# Altium project QiRec-5-T.PrjPcb
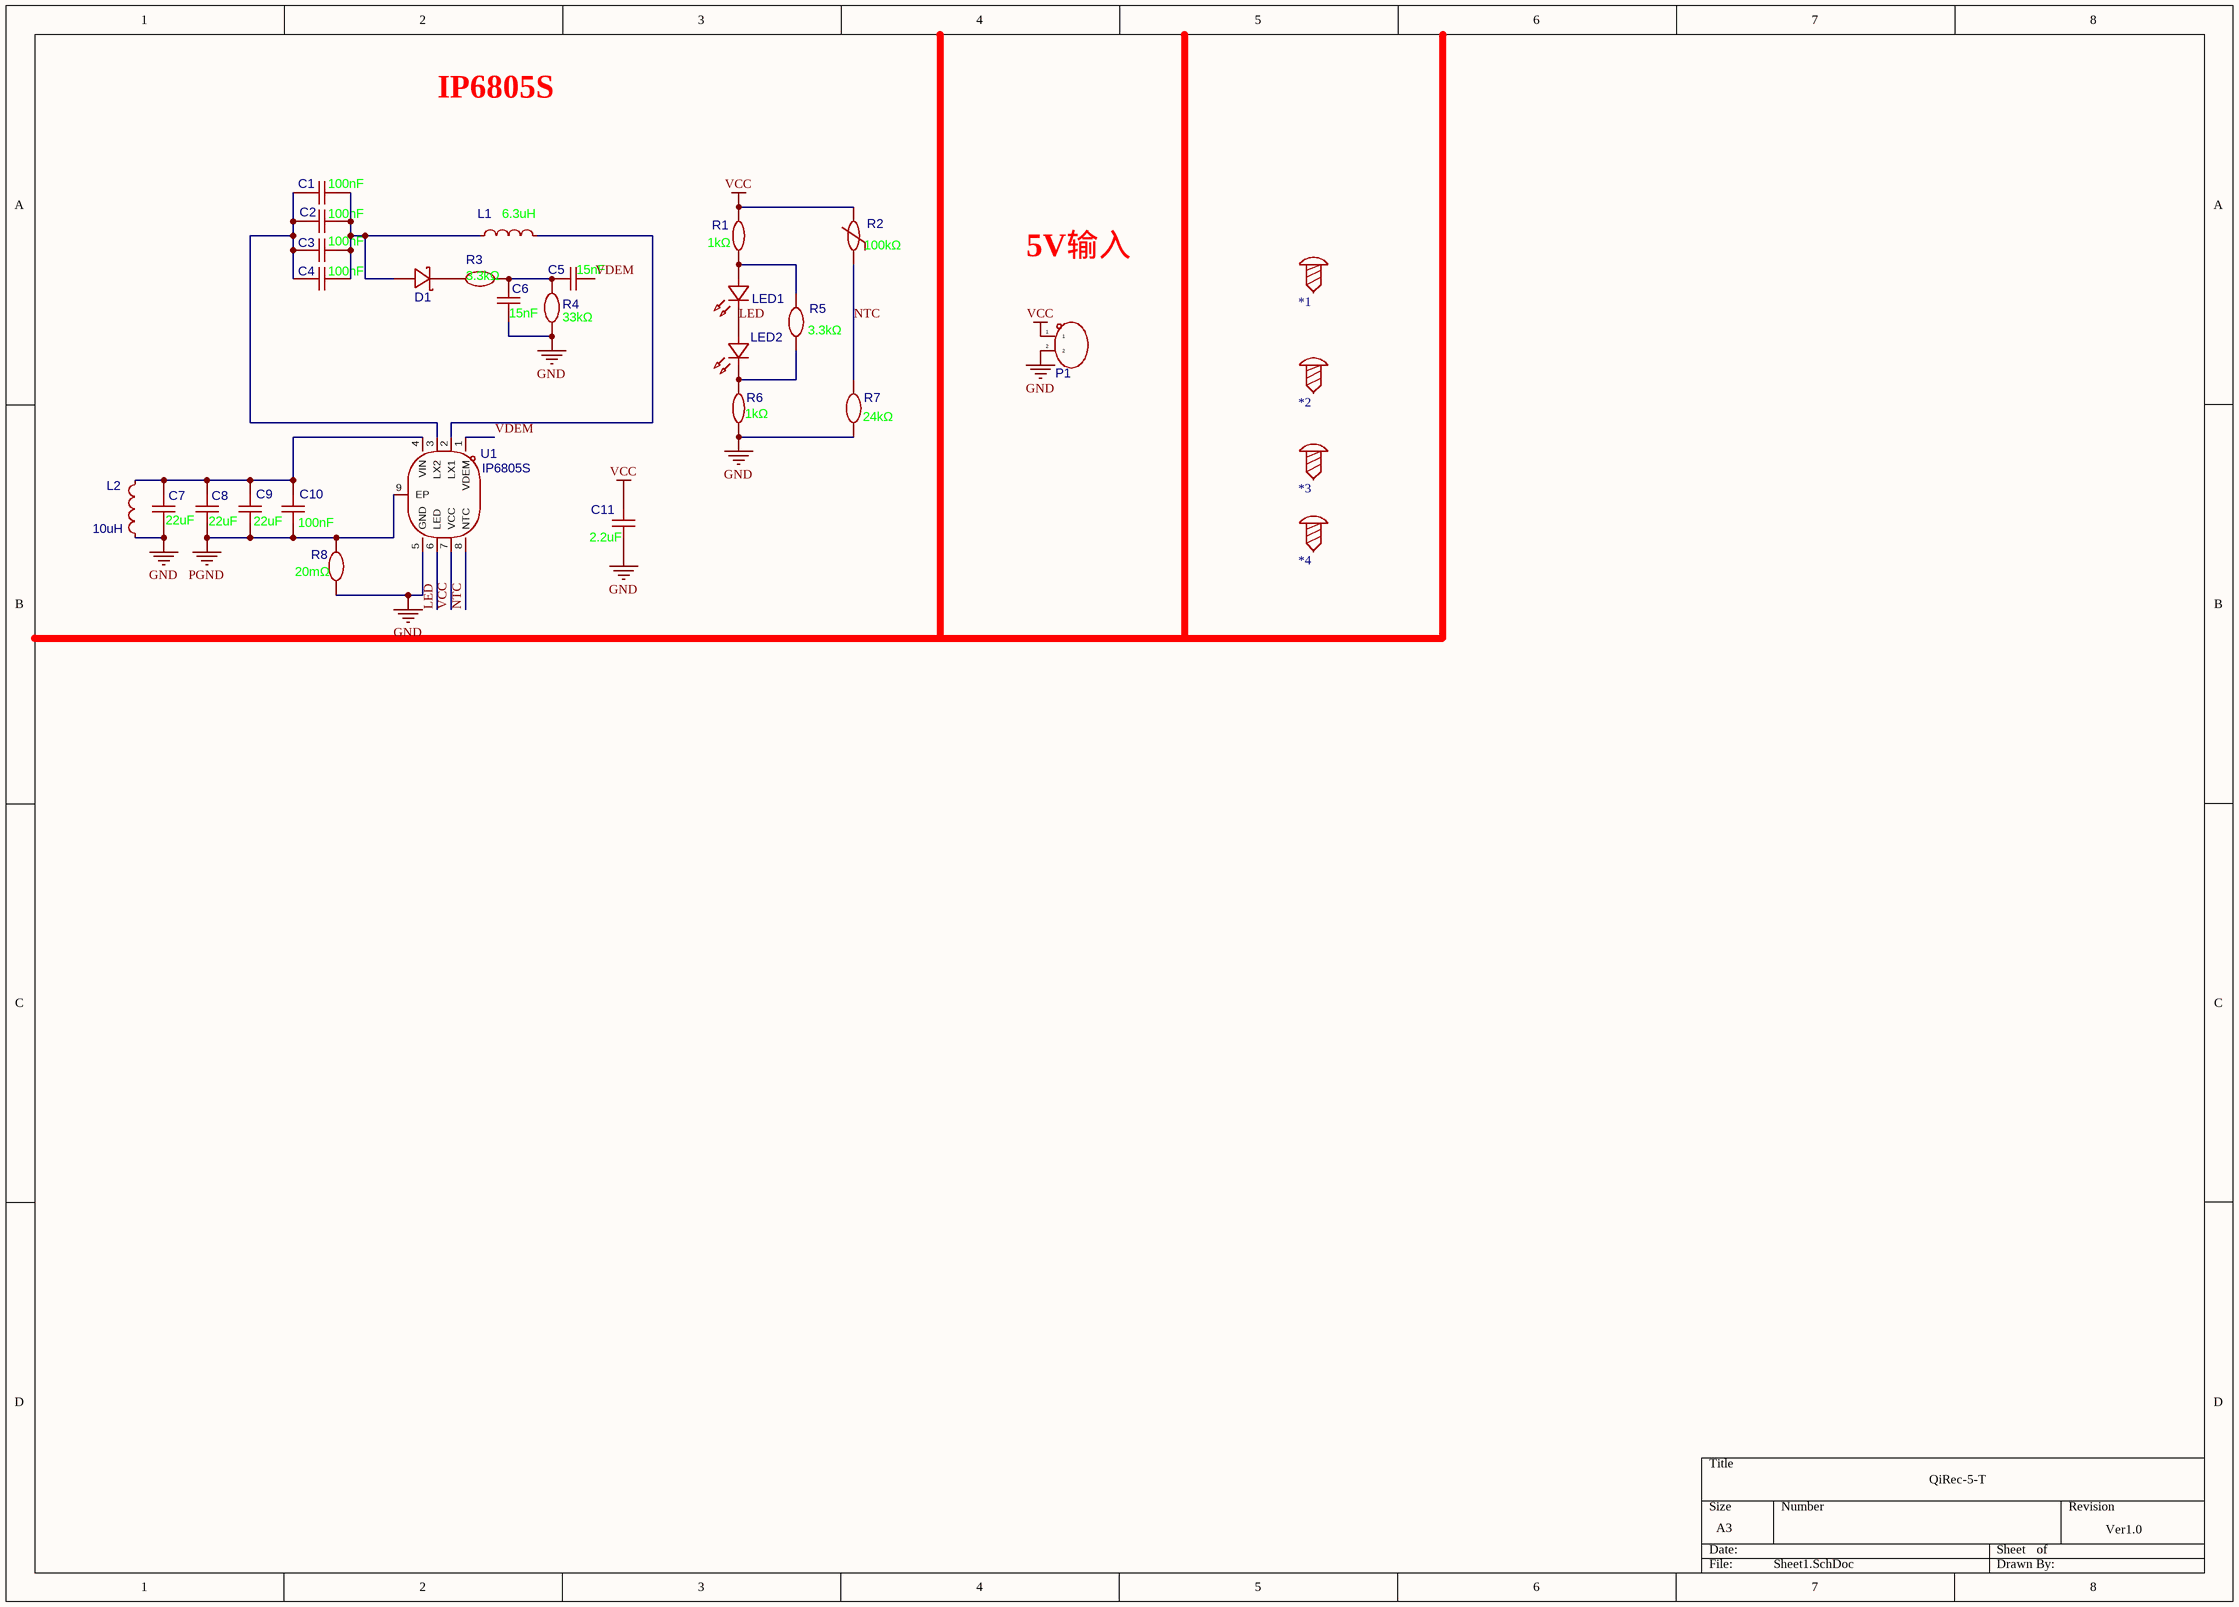
[diagram p0: Sheet1.SchDoc]
1 sheet, 30 parts. Net scope: global (net labels, ports and power ports of the same name join across sheets).
Board file: PCB1.PcbDoc

## Sheet Sheet1.SchDoc
size A3; SheetNumber: 1; SheetTotal: 1

### Parts
*1  螺丝孔_1  [M3螺丝]  (value not drawn)
*2  螺丝孔_1  [M3螺丝]  (value not drawn)
*3  螺丝孔_1  [M3螺丝]  (value not drawn)
*4  螺丝孔_1  [M3螺丝]  (value not drawn)
C1  value 100nF  [C0603]  (hidden comment: cga0603x7r104k500jt)
C2  value 100nF  [C0603]  (hidden comment: cga0603x7r104k500jt)
C3  value 100nF  [C0603]  (hidden comment: cga0603x7r104k500jt)
C4  value 100nF  [C0603]  (hidden comment: cga0603x7r104k500jt)
C5  value 15nF  [C0603]  (hidden comment: cc0603krx7r9bb153)
C6  value 15nF  [C0603]  (hidden comment: cc0603krx7r9bb153)
C7  value 22uF  [C0603]  (hidden comment: hgc0603r5226m160nthj)
C8  value 22uF  [C0603]  (hidden comment: hgc0603r5226m160nthj)
C9  value 22uF  [C0603]  (hidden comment: hgc0603r5226m160nthj)
C10  value 100nF  [C0603]  (hidden comment: cga0603x7r104k500jt)
C11  value 2.2uF  [C0603]  (hidden comment: hgc0603r5225k500nthj)
D1  1n5819ws_c191023  [SOD-323_L1.8-W1.3-LS2.5-RD]  (value not drawn)
L1  value 6.3uH  [IND-SMD_L6.0-W6.0_FNR60XXS]  (hidden comment: fnr6045s6r3mt)
L2  Symbol: 10uH  [BAT-SMD_2P-P2.54_2P-2.54PH-7.0H]  (hidden comment: 10uH_1)
LED1  xl-1005ugc_c965793  [LED0402-RD_GREEN]  (value not drawn)
LED2  xl-1005ugc_c965793  [LED0402-RD_GREEN]  (value not drawn)
P1  wj15edgrc-3.81-02p-14-00a  [CONN-TH_2P-P3.81_WJ15EDGRC-3.81-2P]  (value not drawn)
R1  value 1kΩ  [R0603]  (hidden comment: 0603waf1001t5e)
R2  Resistance @ 25℃: 100kΩ  [R0603]  (hidden comment: hntc0603-104f4250fb)
R3  value 3.3kΩ  [R0603]  (hidden comment: frc0603f3301ts)
R4  value 33kΩ  [R0603]  (hidden comment: frc0603f3302ts)
R5  value 3.3kΩ  [R0603]  (hidden comment: frc0603f3301ts)
R6  value 1kΩ  [R0603]  (hidden comment: 0603waf1001t5e)
R7  value 24kΩ  [R0603]  (hidden comment: frc0603f2402ts)
R8  value 20mΩ  [RES-SMD_L6.4-W3.2-R2512]  (hidden comment: re2512f3r020)
U1  Symbol: IP6805S  [ESOP-8_L4.9-W3.9-P1.27-LS6.0-BL-EP3.1]  (hidden comment: IP6805S_1)

### Nets
GND: C6.1 C7.1 C11.1 L2.1 P1.2 R4.1 R6.1 R7.1 R8.1 U1.5(GND)
PGND: C8.1 C9.1 C10.1 R8.2 U1.9(EP)
VCC: C11.2 P1.1 R1.2 R2.2 U1.7(VCC)
LED: LED1.1(K) LED2.2(A) U1.6(LED)
NTC: R2.1 R7.2 U1.8(NTC)
VDEM: C5.1 U1.1(VDEM)
NetC1_1: C1.1 C2.1 C3.1 C4.1 U1.3(LX2)
NetC1_2: C1.2 C2.2 C3.2 C4.2 D1.2(A) L1.1
NetC5_2: C5.2 C6.2 R3.2 R4.2
NetC7_2: C7.2 C8.2 C9.2 C10.2 L2.2 U1.4(VIN)
NetD1_1: D1.1(K) R3.1
NetL1_2: L1.2 U1.2(LX1)
NetLED1_2: LED1.2(A) R1.1 R5.2
NetLED2_1: LED2.1(K) R5.1 R6.2

Not connected (* = marked no-connect by the designer): *1 1; *2 1; *3 1; *4 1

### Notes on the sheet
- IP6805S
- 5V输入
- QiRec-5-T
- Ver1.0

### Library data of the parts
C1-C4 C10 = cga0603x7r104k500jt: 容值:100nF;精度:±10%;额定电压:50V;温度系数:X7R;; Manufacturer: HRE(芯声); AddInBom: yes; ModelId: ac125912035d415993ca9572d50418b1; ModelName: C0603_L1.6-W0.8-H0.8; ModelTransform: 62.992,31.496,0,0,0,0,0,0,0; Tolerance: ±10%; Voltage Rating: 50V; Temperature Coefficient: X7R; Symbol: CGA0603X7R104K500JT; LCSC Part Name: 100nF ±10% 50V; SupplierPart: C6119867; ManufacturerPart: CGA0603X7R104K500JT; Supplier Footprint: 0603; JLCPCB Part Class: Extended Part; Datasheet: https://item.szlcsc.com/datasheet/CGA0603X7R104K500JT/7062573.html; Supplier: LCSC; ConvertToPcb: yes; FootprintName: C0603
C5 C6 = cc0603krx7r9bb153: 容值:15nF;精度:±10%;额定电压:50V;材质(温度系数):X7R;; Manufacturer: YAGEO(国巨); AddInBom: yes; ModelId: ac125912035d415993ca9572d50418b1; ModelName: C0603_L1.6-W0.8-H0.8; ModelTransform: 62.992,31.496,0,0,0,0,0,0,0; Tolerance: ±10%; Voltage Rated: 50V; Temperature Coefficient: X7R; Symbol: CC0603KRX7R9BB153; LCSC Part Name: 15nF ±10% 50V; SupplierPart: C107076; ManufacturerPart: CC0603KRX7R9BB153; Supplier Footprint: 0603; JLCPCB Part Class: Extended Part; Datasheet: https://atta.szlcsc.com/upload/public/pdf/source/20180910/C282072_33301C7F631E79921B82A8DAC6BCC5B3.pdf; Supplier: LCSC; ConvertToPcb: yes; FootprintName: C0603
C7-C9 = hgc0603r5226m160nthj: 容值:22uF;精度:±20%;额定电压:16V;温度系数:X5R;; Manufacturer: Chinocera(华瓷); AddInBom: yes; ModelId: ac125912035d415993ca9572d50418b1; ModelName: C0603_L1.6-W0.8-H0.8; ModelTransform: 62.992,31.496,0,0,0,0,0,0,0; Tolerance: ±20%; Voltage Rating: 16V; Temperature Coefficient: X5R; Symbol: HGC0603R5226M160NTHJ; LCSC Part Name: 22uF ±20% 16V; SupplierPart: C22367828; ManufacturerPart: HGC0603R5226M160NTHJ; Supplier Footprint: 0603; JLCPCB Part Class: Extended Part; Datasheet: https://item.szlcsc.com/datasheet/HGC0603R5226M160NTHJ/23841133.html; Supplier: LCSC; ConvertToPcb: yes; FootprintName: C0603
C11 = hgc0603r5225k500nthj: 容值:2.2uF;精度:±10%;额定电压:50V;温度系数:X5R;; Manufacturer: Chinocera(华瓷); AddInBom: yes; ModelId: ac125912035d415993ca9572d50418b1; ModelName: C0603_L1.6-W0.8-H0.8; ModelTransform: 62.992,31.496,0,0,0,0,0,0,0; Tolerance: ±10%; Voltage Rating: 50V; Temperature Coefficient: X5R; Symbol: HGC0603R5225K500NTHJ; LCSC Part Name: 2.2uF ±10% 50V; SupplierPart: C7432769; ManufacturerPart: HGC0603R5225K500NTHJ; Supplier Footprint: 0603; JLCPCB Part Class: Extended Part; Datasheet: https://item.szlcsc.com/datasheet/HGC0603R5225K500NTHJ/8438251.html; Supplier: LCSC; ConvertToPcb: yes; FootprintName: C0603
D1 = 1n5819ws_c191023: 正向压降(Vf):600mV@1A;直流反向耐压(Vr):40V;整流电流:1A;; Manufacturer: Hottech(合科泰); AddInBom: yes; ModelId: db63db13d9e342eb939127d413d6200b; ModelTransform: 104.3305,51.181,0,0,0,0,0,-0.004,0; Voltage - DC Reverse(Vr): 40V; Current - Rectified: 1A; Non-Repetitive Peak Forward Surge Current: 25A; Symbol: 1N5819WS; LCSC Part Name: 电压:40V 电流:1A; SupplierPart: C191023; ManufacturerPart: 1N5819WS; Supplier Footprint: SOD-323; JLCPCB Part Class: Basic Part; Datasheet: https://item.szlcsc.com/datasheet/1N5819WS/213850.html; Supplier: LCSC; ConvertToPcb: yes; FootprintName: SOD-323_L1.8-W1.3-LS2.5-RD; ModelName: SOD-323_L1.8-W1.3-LS2.5-RD; Voltage - Forward(Vf@If): 600mV@1A
L1 = fnr6045s6r3mt: 电感值:6.3uH;精度:±20%;额定电流:3.3A;饱和电流(Isat):4.7A;类型:磁胶屏蔽绕线合金电感;; Manufacturer: cjiang(长江微电); AddInBom: yes; ModelId: a3b1a14981914683918d1fd1319c5d5c; ModelName: IND-SMD_L6.0-W6.0-H2.8; ModelTransform: 236.22,237.007,0,90,0,0,0,0,0; Tolerance: ±20%; Current Rating: 3.3A; Current - Saturation(Isat): 4.7A; DC Resistance(DCR): 40mΩ; Symbol: FNR6045S6R3MT; LCSC Part Name: 6.3uH ±20% 4.7A; SupplierPart: C168071; ManufacturerPart: FNR6045S6R3MT; Supplier Footprint: SMD,6x6mm; JLCPCB Part Class: Extended Part; Datasheet: https://atta.szlcsc.com/upload/public/pdf/source/20190327/C167925_9EFF0AABC4CA629C2CC95961DBF7D39D.pdf; Supplier: LCSC; ConvertToPcb: yes; FootprintName: IND-SMD_L6.0-W6.0_FNR60XXS; Type: 磁胶屏蔽绕线合金电感
LED1 LED2 = xl-1005ugc_c965793: 灯头类型:1.0mmx0.5mm方形灯头;发光颜色:翠绿色;正向压降(Vf):3V;功率:80mW;正向电流:25mA;波长:516nm~531nm;二极管配置:独立二极管;透镜颜色:无色透明透镜;色温:-;发光强度:249mcd;发光角度:120°;载带方式:正贴;工作温度:-40℃~+85℃;; Manufacturer: XINGLIGHT(成兴光); AddInBom: yes; ModelId: 080bb9bd520f4b34ac21e218e7b036d6; ModelName: LED0402_L1.0-W0.5-H0.2; ModelTransform: 40.1574,19.685,0,0,0,0,0,-0.0005,0; Illumination Color: 翠绿色; Voltage - Forward(Vf): 3V; Power(Watts): 80mW; Forward Current: 25mA; Peak Wavelength: 531nm; Diode Configuration: 独立二极管; Lens Color: 无色透明透镜; Luminous Intensity: 249mcd; Viewing Angle: 120°; Symbol: XL-1005UGC; LCSC Part Name: 0402翠绿贴片式发光二极管; SupplierPart: C965793; ManufacturerPart: XL-1005UGC; Supplier Footprint: 0402; JLCPCB Part Class: Extended Part; Datasheet: https://item.szlcsc.com/datasheet/XL-1005UGC/1051402.html; Supplier: LCSC; ConvertToPcb: yes; FootprintName: LED0402-RD_GREEN; Lamp Holder Type: 1.0mmx0.5mm方形灯头; Wavelength - Dominant: 516nm~531nm; Color Temperature: -; Mounting Style: 正贴; Operating Temperature: -40℃~+85℃
P1 = wj15edgrc-3.81-02p-14-00a: 连接器类型:板端/插座-闭口;固定方式:无固定装置;结构:1x2P;间距:3.81mm;颜色:绿色;安装方式:弯插;排数:1;每排PIN数:2;额定电流:8A;额定电压:300V;线规 - AWG:-;线规 - 平方毫米:-;工作温度:-40℃~+105℃;; Manufacturer: KANGNEX(康奈克斯电气); Symbol: WJ15EDGRC-3.81-2P; AddInBom: yes; ModelId: 816ec8aca6fe4785be70cb4c5121258d; ModelName: CONN-TH_2P_L8.5-W9.2-H7.0-P3.81; ModelTransform: 334.645,360.2355,0,0,0,0,0,-118.11,-137.795; Number of Positions or Pins: 1x2P; Pitch: 3.81mm; Number of PINs Per Row: 2; Current Rating: 8A; Voltage Rating (Max): 300V; LCSC Part Name: 无固定装置 1x2P 3.81mm 排数:1 每排P数:2; SupplierPart: C8387; ManufacturerPart: WJ15EDGRC-3.81-02P-14-00A; Supplier Footprint: 弯插,P=3.81mm; JLCPCB Part Class: Extended Part; Datasheet: https://item.szlcsc.com/datasheet/WJ15EDGRC-3.81-02P-14-00A/8881.html; Supplier: LCSC; ConvertToPcb: yes; FootprintName: CONN-TH_2P-P3.81_WJ15EDGRC-3.81-2P; Connector Type: 板端/插座-闭口; Termination Style: 无固定装置; Color: 绿色; Mounting Type: 弯插; Number of Pins: 2P; Number of Rows: 1; Wire Gauge - AWG: -; Wire Gauge - mm2: -; Operating Temperature: -40℃~+105℃; Connection Type: -; Outlet Direction (Vertical Basis): -
R1 R6 = 0603waf1001t5e: 电阻类型:厚膜电阻;阻值:1kΩ;精度:±1%;功率:100mW;工作电压:75V;温度系数:±100ppm/℃;; Manufacturer: UNI-ROYAL(厚声); AddInBom: yes; ModelId: fc143cca1e79419f9cd78b61e9279f08; ModelTransform: 31.8897,63.7794,0,90,0,0,0,0,0; Tolerance: ±1%; Power(Watts): 100mW; Voltage-Supply(Max): 75V; Symbol: 0603WAF1001T5E; LCSC Part Name: 1kΩ ±1% 100mW 厚膜电阻; SupplierPart: C21190; ManufacturerPart: 0603WAF1001T5E; Supplier Footprint: 0603; JLCPCB Part Class: Basic Part; Datasheet: https://item.szlcsc.com/datasheet/0603WAF1001T5E/21904.html; Supplier: LCSC; ConvertToPcb: yes; FootprintName: R0603; ModelName: R0603; Type: 厚膜电阻; Temperature Coefficient: ±100ppm/℃; Operating Temperature: -55℃~+155℃
R2 = hntc0603-104f4250fb: 功率:100mW;阻值:100kΩ;电阻精度:±1%;B值精度:±1%;B值(25℃/50℃):4250K;最大稳态电流(25℃):10uA;; Manufacturer: R+O(宏嘉诚); AddInBom: yes; ModelId: fc143cca1e79419f9cd78b61e9279f08; ModelTransform: 31.8897,63.7794,0,90,0,0,0,0,0; Power(Watts): 100mW; Resistance Tolerance: ±1%; B Constant (25℃/50℃): 4250K; Steady State Current (Max): 10uA; Dissipation Factor: 1mW/℃; Thermal Time Constant: 5s; Pitch: 0.3mm; Symbol: HNTC0603-104F4250FB; LCSC Part Name: 贴片NTC热敏电阻; SupplierPart: C49247679; ManufacturerPart: HNTC0603-104F4250FB; Supplier Footprint: 0603; JLCPCB Part Class: Extended Part; Datasheet: https://item.szlcsc.com/datasheet/HNTC0603-104F4250FB/51678332.html; Supplier: LCSC; ConvertToPcb: yes; FootprintName: R0603; ModelName: R0603; B Constant Tolerance: ±1%; B Constant (25℃/75℃): -; B Constant (25℃/85℃): -; B Constant (25℃/100℃): -; Operating Temperature: -40℃~+125℃; Diameter (φD): -; Length: 1.6mm; Width: 0.8mm; Height: 0.8mm
R3 R5 = frc0603f3301ts: 电阻类型:厚膜电阻;阻值:3.3kΩ;精度:±1%;功率:100mW;工作电压:75V;温度系数:±100ppm/℃;; Manufacturer: FOJAN(富捷); AddInBom: yes; ModelId: fc143cca1e79419f9cd78b61e9279f08; ModelTransform: 31.8897,63.7794,0,90,0,0,0,0,0; Tolerance: ±1%; Power(Watts): 100mW; Voltage-Supply(Max): 75V; Symbol: FRC0603F3301TS; LCSC Part Name: 3.3kΩ ±1% 100mW 厚膜电阻; SupplierPart: C2907023; ManufacturerPart: FRC0603F3301TS; Supplier Footprint: 0603; JLCPCB Part Class: Extended Part; Datasheet: https://item.szlcsc.com/datasheet/FRC0603F3301TS/3180536.html; Supplier: LCSC; ConvertToPcb: yes; FootprintName: R0603; ModelName: R0603; Type: 厚膜电阻; Temperature Coefficient: ±100ppm/℃; Operating Temperature: -55℃~+155℃
R4 = frc0603f3302ts: 电阻类型:厚膜电阻;阻值:33kΩ;精度:±1%;功率:100mW;工作电压:75V;温度系数:±100ppm/℃;; Manufacturer: FOJAN(富捷); AddInBom: yes; ModelId: fc143cca1e79419f9cd78b61e9279f08; ModelTransform: 31.8897,63.7794,0,90,0,0,0,0,0; Tolerance: ±1%; Power(Watts): 100mW; Voltage-Supply(Max): 75V; Symbol: FRC0603F3302TS; LCSC Part Name: 33kΩ ±1% 100mW 厚膜电阻; SupplierPart: C2907028; ManufacturerPart: FRC0603F3302TS; Supplier Footprint: 0603; JLCPCB Part Class: Extended Part; Supplier: LCSC; ConvertToPcb: yes; FootprintName: R0603; ModelName: R0603; Type: 厚膜电阻; Temperature Coefficient: ±100ppm/℃; Operating Temperature: -55℃~+155℃
R7 = frc0603f2402ts: 电阻类型:厚膜电阻;阻值:24kΩ;精度:±1%;功率:100mW;工作电压:75V;温度系数:±100ppm/℃;; Manufacturer: FOJAN(富捷); AddInBom: yes; ModelId: fc143cca1e79419f9cd78b61e9279f08; ModelTransform: 31.8897,63.7794,0,90,0,0,0,0,0; Tolerance: ±1%; Power(Watts): 100mW; Voltage-Supply(Max): 75V; Symbol: FRC0603F2402TS; LCSC Part Name: 24kΩ ±1% 100mW 厚膜电阻; SupplierPart: C2930081; ManufacturerPart: FRC0603F2402TS; Supplier Footprint: 0603; JLCPCB Part Class: Extended Part; Supplier: LCSC; ConvertToPcb: yes; FootprintName: R0603; ModelName: R0603; Type: 厚膜电阻; Temperature Coefficient: ±100ppm/℃; Operating Temperature: -55℃~+155℃
R8 = re2512f3r020: 电阻类型:采样电阻；合金电阻;阻值:20mΩ;精度:±1%;功率:3W;温度系数:±50ppm/℃;安装方式:贴片;; Manufacturer: JIERR(捷而瑞); AddInBom: yes; ModelId: 3c946b39f1b547de9af067cb1ede82cc; ModelTransform: 252.7554,126.7714,0,0,0,0,0,0,0; Tolerance: ±1%; Power(Watts): 3W; Symbol: RE2512F3R020; LCSC Part Name: 20mΩ 3W 2512 ±1%; SupplierPart: C46961755; ManufacturerPart: RE2512F3R020; Supplier Footprint: 2512; JLCPCB Part Class: Extended Part; Datasheet: https://item.szlcsc.com/datasheet/RE2512F3R020/49133294.html; Supplier: LCSC; ConvertToPcb: yes; FootprintName: RES-SMD_L6.4-W3.2-R2512; ModelName: RES-SMD_L6.4-W3.2-R2512; Type: 采样电阻；合金电阻; Temperature Coefficient: ±50ppm/℃; Mounting Type: 贴片